# EasyEDA Pro project ProPrj_国赛底层板子_2026-05-31.epro, board 1-PCB_pcb1
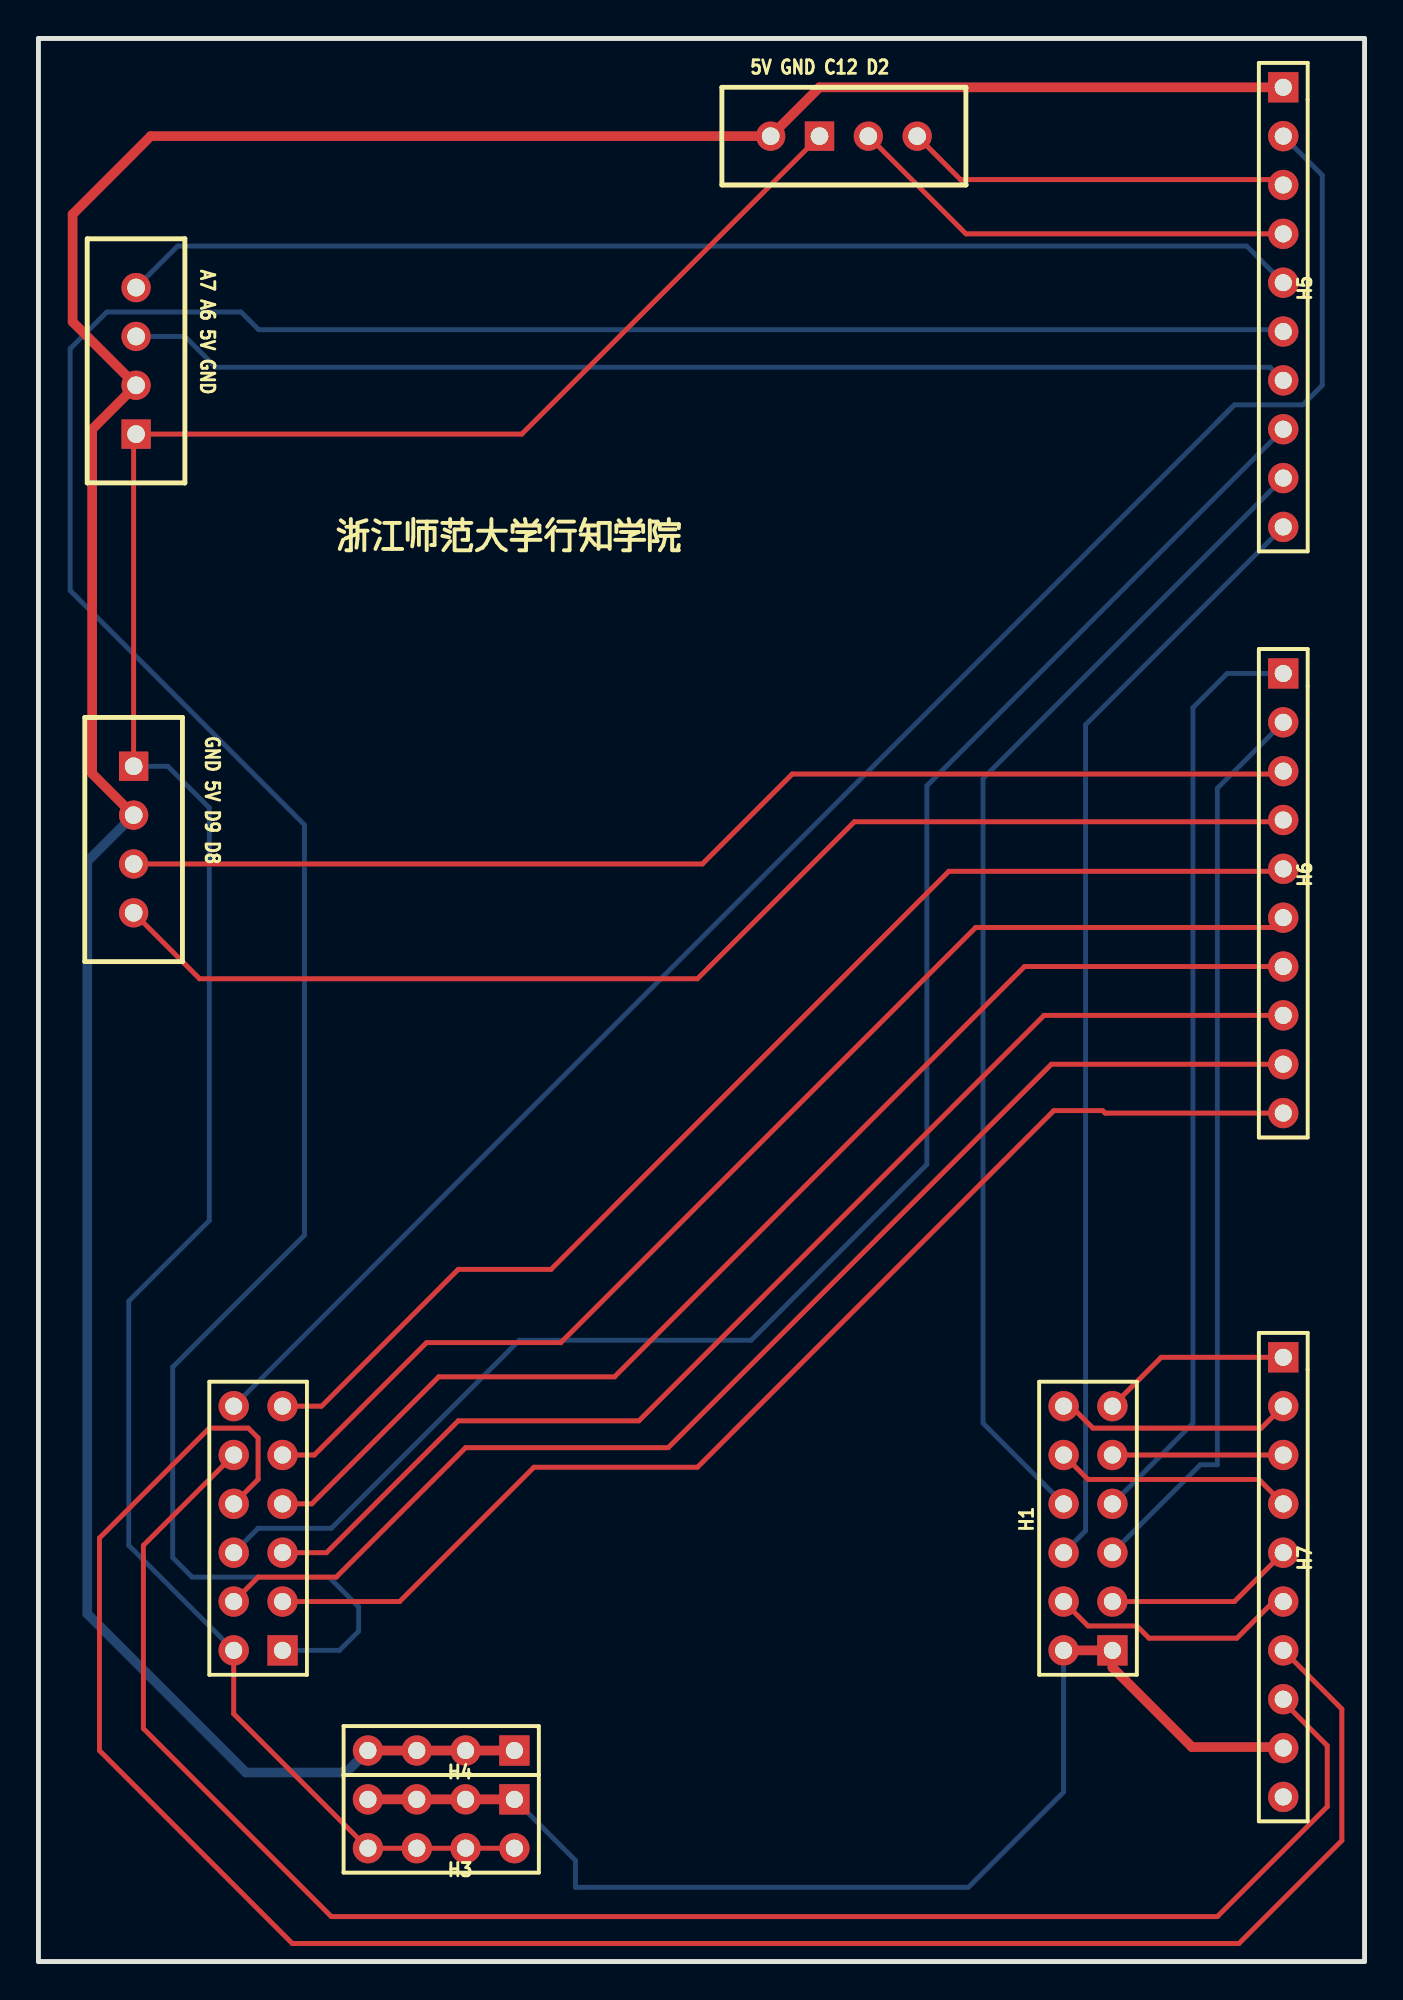
[diagram p7: board, top side]
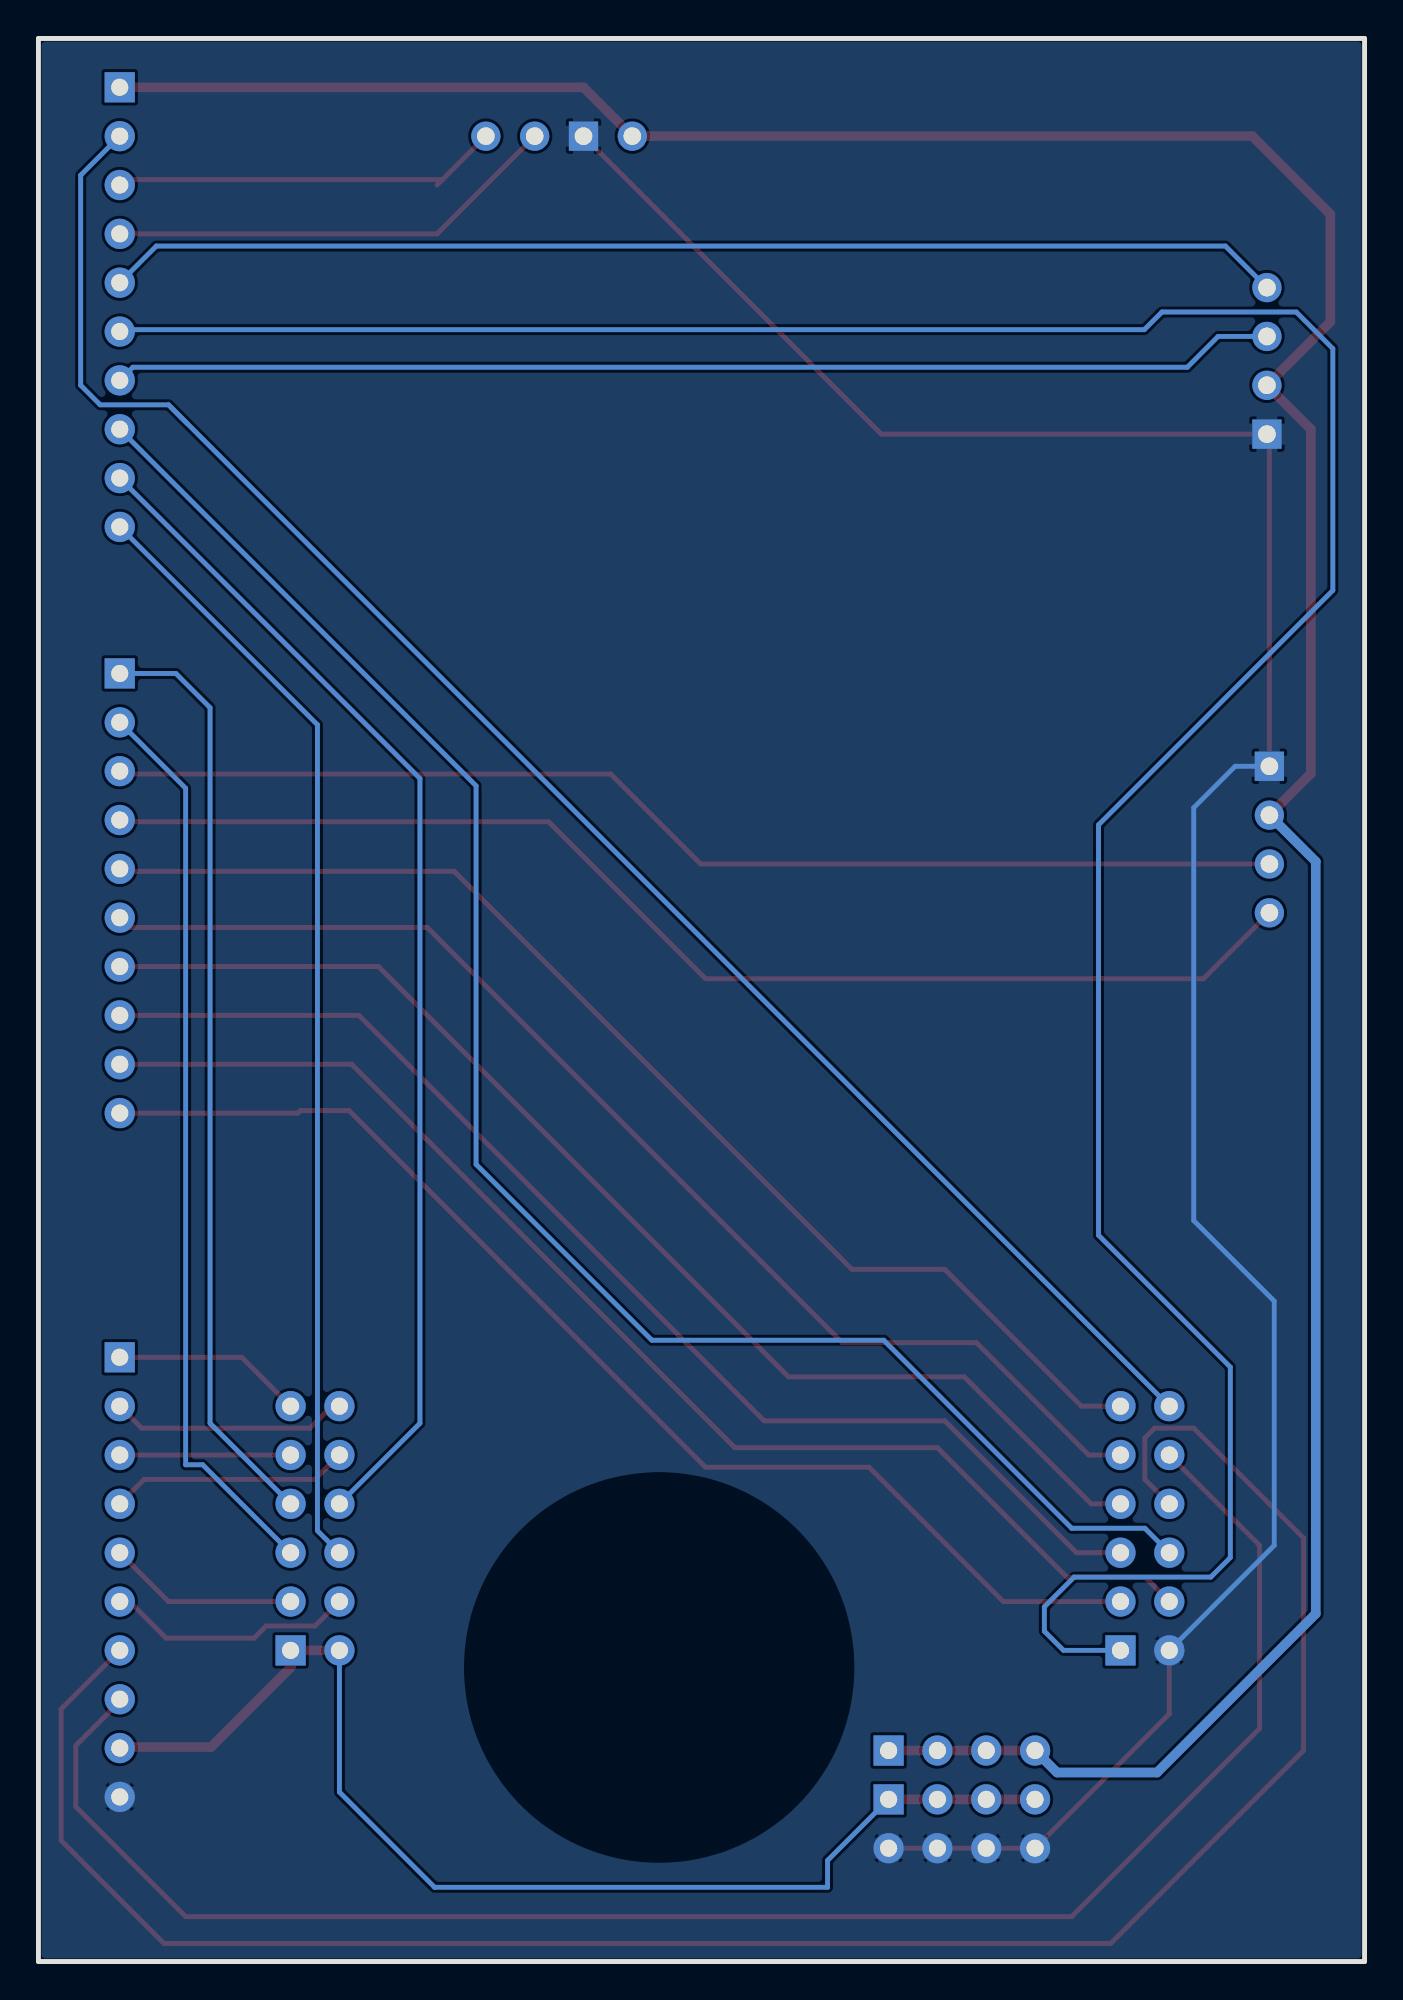
[diagram p8: board, bottom side, seen from below]

Outline 69 x 100 mm; copper layers: Top Layer, Bottom Layer. Coordinates in mm from the lower left corner of the outline.
Outline path: 0,100 69,100 69,0 0,0 0,100
Stack: Top Layer 0.035mm / Dielectric1 1.51mm FR4 er 4.5 / Bottom Layer 0.035mm

## Design rules (mm)
spacing Default (default): track to track 0.152, other pairs 0 to 0.152
track width Default (default): min 0.254, default 0.254, max 25.4
differential pair differentialPair (default): width min 0.127, default 0.254, max 2.54; gap min 0.152, default 0.152
via Default (default): diameter min 0.61, default 0.61, max 100.025; hole min 0.305, default 0.305, max 59.995
pour e67 uses gge5594
pour e70 uses gge5594

## Placement (name value [footprint] x y rotation side)
H1  HDR-F-2.54_2x6  [HDR-F-2.54_2X6]  54.61 22.53 90 top
H2  HDR-F-2.54_2x6  [HDR-F-2.54_2X6]  11.43 22.53 90 top
H3  HDR-F-2.54_2x4  [HDR-F-2.54_2X4]  20.96 7.16 180 top
H4  HDR-F-2.54_1x4  [HDR-F-2.54_1X4]  20.96 10.97 180 top
H5  HDR-F-2.54_1x10  [HDR-F-2.54_1X10]  64.77 86.03 270 top
H6  HDR-F-2.54_1x10  [HDR-F-2.54_1X10]  64.77 55.55 270 top
H7  HDR-F-2.54_1x10  [HDR-F-2.54_1X10]  64.77 19.99 270 top
J2  N100  [OLED10.96OLED#2]  38.1 94.92 0 top
J6  TOF  [OLED10.96OLED#3]  4.95 62.15 270 top
U1  OLED 0.96OLED  [OLED10.96OLED]  5.08 79.43 90 top

## Footprints (pads in the part's own frame, mm; a bottom-side part is the same pattern mirrored in y, then rotated)
HDR-F-2.54_1X4
  rect 1.575x1.575 hole 0.889: 1(-3.81,0)
  round 1.575 hole 0.889: 2(-1.27,0) 3(1.27,0) 4(3.81,0)
HDR-F-2.54_1X10
  rect 1.575x1.575 hole 0.889: 1(-11.43,0)
  round 1.575 hole 0.889: 2(-8.89,0) 3(-6.35,0) 4(-3.81,0) 5(-1.27,0) 6(1.27,0) 7(3.81,0) 8(6.35,0) 9(8.89,0) 10(11.43,0)
HDR-F-2.54_2X4
  rect 1.575x1.575 hole 0.889: 1(-3.81,-1.27)
  round 1.575 hole 0.889: 2(-3.81,1.27) 3(-1.27,-1.27) 4(-1.27,1.27) 5(1.27,-1.27) 6(1.27,1.27) 7(3.81,-1.27) 8(3.81,1.27)
HDR-F-2.54_2X6
  rect 1.575x1.575 hole 0.889: 1(-6.35,-1.27)
  round 1.575 hole 0.889: 2(-6.35,1.27) 3(-3.81,-1.27) 4(-3.81,1.27) 5(-1.27,-1.27) 6(-1.27,1.27) 7(1.27,-1.27) 8(1.27,1.27) 9(3.81,-1.27) 10(3.81,1.27) 11(6.35,-1.27) 12(6.35,1.27)
OLED10.96OLED
  rect 1.524x1.524 hole 0.919x0.914: 1(0,0)
  round 1.524 hole 0.919x0.914: 2(2.54,0) 3(5.08,0) 4(7.62,0)
OLED10.96OLED#2
  round 1.524 hole 0.914: 1(0,0) 3(5.08,0) 4(7.62,0)
  rect 1.524x1.524 hole 0.914: 2(2.54,0)
OLED10.96OLED#3
  rect 1.524x1.524 hole 0.914: 1(0,0)
  round 1.524 hole 0.914: 2(2.54,0) 3(5.08,0) 4(7.62,0)

## Nets
As in the schematic.

## Routing (per net, layer and track width the routed paths; a pad name or vN(x,y) marks a point on that pad's centre or on a via; arc(x,y) is an arc through that point)
3V3: length 62.4
  Top Layer w0.5: 24.76,8.43 17.14,8.43 ; H7.9 64.72,11.15 60.02,11.15 55.88,15.29 H1.1 H1.2
  Bottom Layer w0.254: 24.76,8.43 27.94,5.26 27.94,3.86 48.39,3.86 53.34,8.81 H1.2
5V: length 168.8
  Top Layer w0.5: 24.76,10.97 H4.3 17.14,10.97 ; H5.1 40.64,97.46 J2.1 5.84,94.92 1.78,90.86 1.78,85.27 U1.2 2.79,79.68 2.79,61.77 J6.2
  Bottom Layer w0.5: 17.14,10.97 16,9.83 10.8,9.83 2.54,18.09 2.54,57.2 J6.2
GND: length 132.7
  Top Layer w0.254: J2.2 25.15,79.43 U1.1 4.95,79.3 J6.1 ; 24.76,5.89 H3.6 17.14,5.89 10.16,12.88 H2.2
  Bottom Layer w0.254: J6.1 6.73,62.15 8.89,60 8.89,38.53 4.7,34.34 4.7,21.64 H2.2
A0: length 63.6
  Top Layer w0.254: H6.6 64.26,53.77 48.77,53.77 27.18,32.18 20.19,32.18 14.35,26.34 H2.9
A1: length 63.6
  Top Layer w0.254: H6.5 64.64,56.69 47.37,56.69 26.67,35.99 21.84,35.99 14.73,28.88 H2.11
A5: length 151.5
  Bottom Layer w0.254: H2.1 15.66,16.18 16.66,17.18 16.66,18.44 15.11,19.99 8,19.99 6.98,21.01 6.98,30.91 13.84,37.77 13.84,59.11 1.65,71.3 1.65,83.87 3.56,85.78 10.54,85.78 11.46,84.86 64.67,84.86 H5.6
A6: length 60.6
  Bottom Layer w0.254: U1.3 7.62,84.51 9.22,82.9 64.09,82.9 H5.7
A7: length 61.4
  Bottom Layer w0.254: H5.5 62.87,89.2 7.24,89.2 U1.4
B0: length 61.5
  Bottom Layer w0.254: H5.9 49.15,61.52 49.15,27.99 H1.8
B1: length 58.1
  Bottom Layer w0.254: H5.10 54.48,64.31 54.48,22.4 H1.6
B4: length 12.5
  Top Layer w0.254: H1.10 54.61,25.07 63.5,25.07 H7.4
B5: length 12.4
  Top Layer w0.254: H1.12 53.72,28.88 54.86,27.74 63.63,27.74 H7.2
B6: length 8.9
  Top Layer w0.254: H1.9 H7.3
B7: length 9.9
  Top Layer w0.254: H1.11 58.42,31.42 H7.1
B12: length 63.6
  Top Layer w0.254: H2.5 14.99,21.26 21.84,28.12 31.24,28.12 52.32,49.2 H6.8
B13: length 63.6
  Top Layer w0.254: H2.7 14.22,23.8 20.83,30.4 29.97,30.4 51.31,51.74 H6.7
C0: length 47.4
  Bottom Layer w0.254: H1.5 60.45,25.83 61.34,25.83 61.34,61.01 H6.2
C1: length 48.8
  Top Layer w0.254: 56.01,23.67 H1.7
  Bottom Layer w0.254: H1.7 60.07,27.99 60.07,65.2 61.85,66.98 H6.1
C6: length 93.6
  Bottom Layer w0.254: H5.2 66.8,92.89 66.8,81.97 65.79,80.95 62.23,80.95 61.28,80 ; H2.12 62.1,80.82
C7: length 90.7
  Top Layer w0.254: H2.10 5.46,21.64 5.46,12.12 15.24,2.34 61.34,2.34 67.06,8.05 67.06,11.23 64.77,13.51 H7.8
C10: length 108
  Top Layer w0.254: H2.8 11.43,25.07 11.43,27.23 10.92,27.74 8.89,27.74 3.17,22.02 3.17,10.97 13.21,0.94 62.47,0.94 67.82,6.29 67.82,13.13 H7.7
C12: length 23.7
  Top Layer w0.254: J2.3 48.26,89.84 H5.4
D2: length 20.5
  Top Layer w0.254: H5.3 64.49,92.66 47.98,92.66 ; 48.26,92.38 J2.4
D8: length 64.7
  Top Layer w0.254: J6.4 8.38,51.11 34.29,51.11 42.45,59.27 64.68,59.27 H6.4
D9: length 61.8
  Top Layer w0.254: H6.3 64.62,61.75 39.22,61.75 34.54,57.07 J6.3
E9: length 66.2
  Top Layer w0.254: H6.9 52.71,46.66 32.77,26.72 22.22,26.72 15.49,19.99 11.43,19.99 H2.4
E11: length 62.7
  Top Layer w0.254: H6.10 55.5,44.12 55.37,44.25 52.83,44.25 34.29,25.71 25.78,25.71 18.8,18.72 H2.3
E13: length 13
  Top Layer w0.254: H7.6 64.26,18.72 62.36,16.81 57.78,16.81 57.15,17.45 54.61,17.45 H1.4
E14: length 9.9
  Top Layer w0.254: H7.5 62.23,18.72 H1.3
F11: length 90.3
  Bottom Layer w0.254: H5.8 46.23,61.14 46.23,41.45 37.08,32.31 25.02,32.31 15.24,22.53 11.43,22.53 H2.6

## Copper pours and planes (outline as drawn; the poured copper is in the pictures)
GND on Bottom Layer: 70.1,-3.25 73.15,-6.3 -11.94,-6.3 -16.64,-1.6 -16.64,89.08 -0.25,105.46 66.68,105.46 70.1,102.03
GND on Bottom Layer: -0.64,101.14 -4.19,101.14 0,101.78

## Text on the board
Top Silkscreen Layer: 5V GND C12 D2 | A7 A6 5V GND | GND 5V D9 D8 | 浙江师范大学行知学院
